# EAGLE design domoLogger (EAGLE 9.6.2)
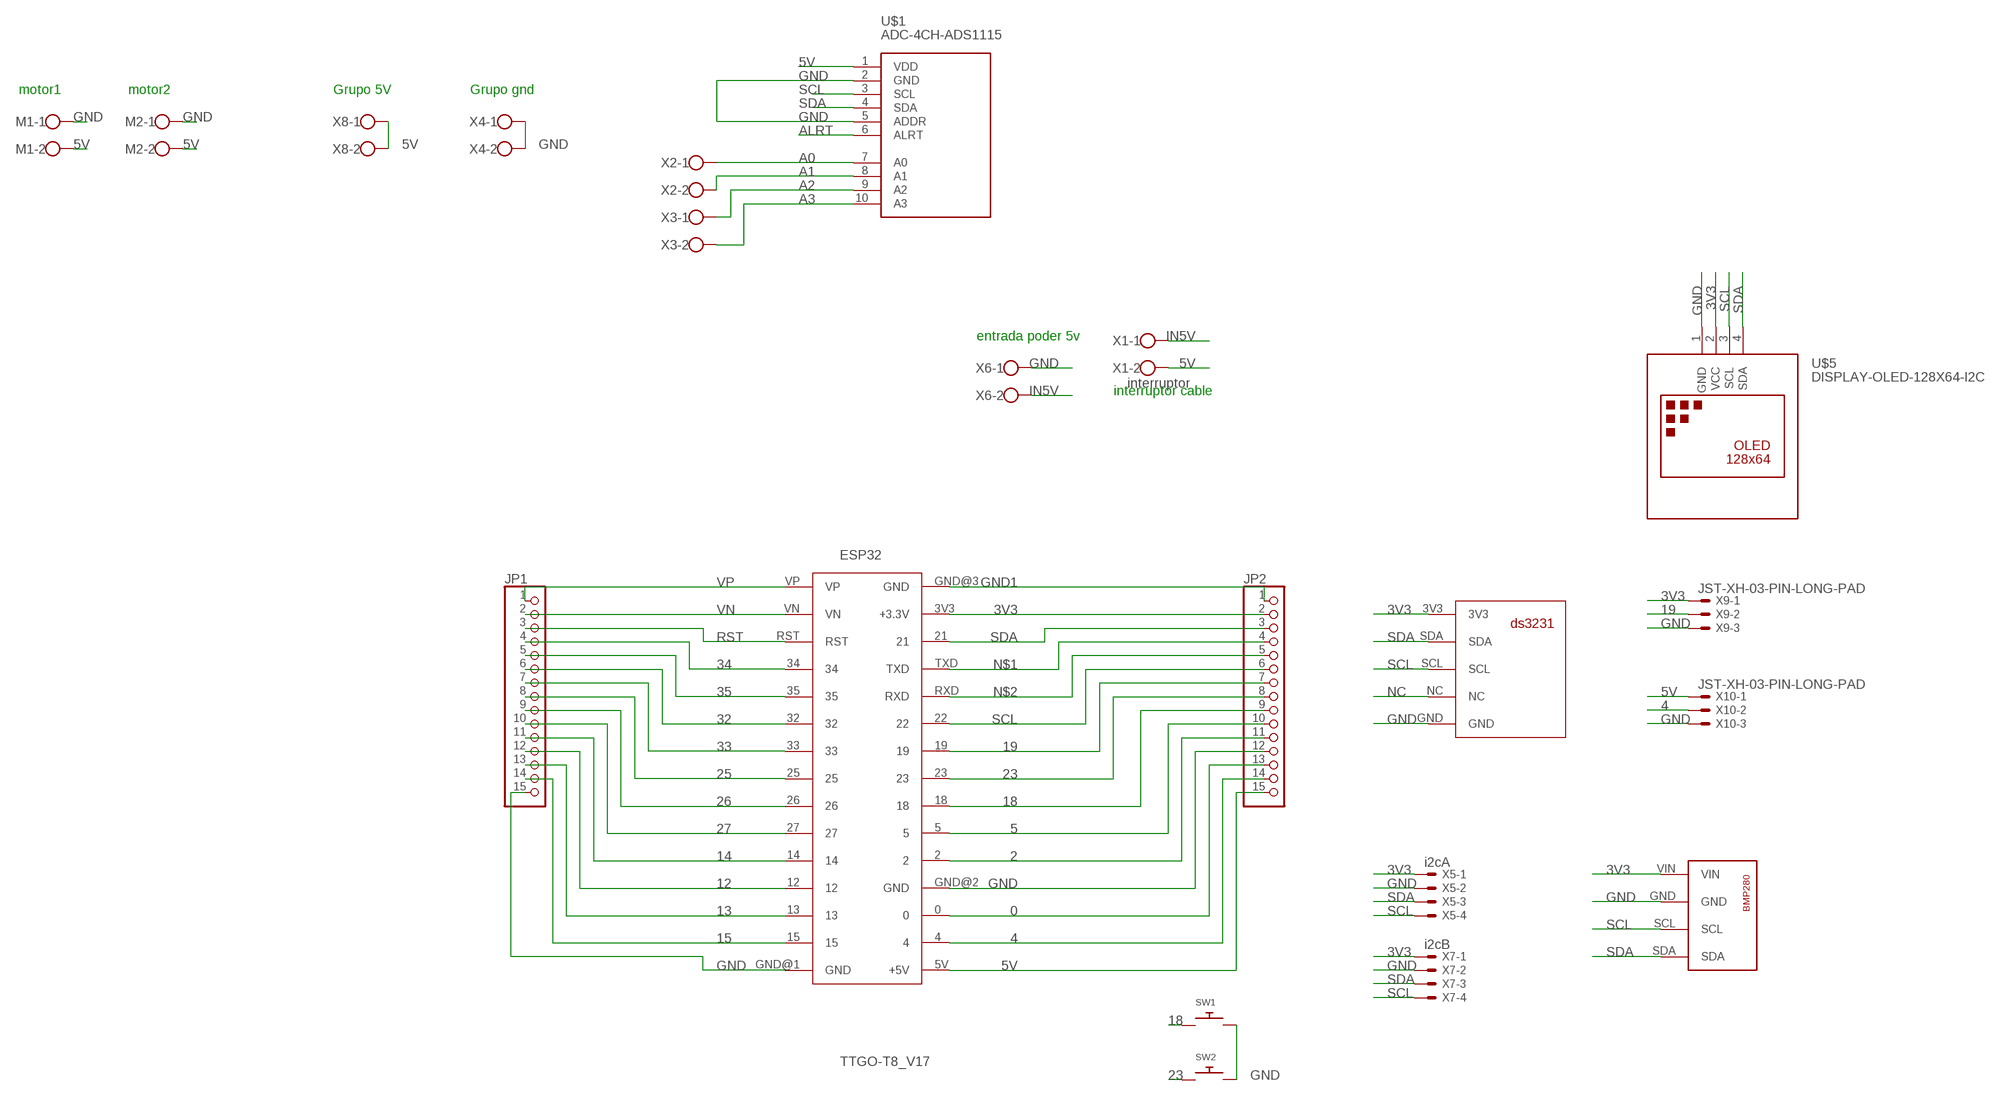
[diagram p0: schematic, sheet 1]

## Parts
ESP32  TTGO-T8_V17  [TTGO-T8_V17]
JP1  PINHD-1X15  [1X15]
JP2  PINHD-1X15  [1X15]
M1  W237-102  [W237-102]
M2  W237-102  [W237-102]
SW1  SWITCH_PUSHBUTTONEVQ-PE  [TACT_PANA-EVQ]
SW2  SWITCH_PUSHBUTTONEVQ-PE  [TACT_PANA-EVQ]
U$1  ADC-4CH-ADS1115  [ADC-4CH-ADS1115]
U$3  GYBMEP_BMP280THROUGH_THE_HOLE  [GYBMEP_BMP280]
U$4  RTC  [RTCDS3231FP]
U$5  DISPLAY-OLED-128X64-I2C  [DISPLAY-OLED-128X64-I2C]
X1  interruptor  W237-102  [W237-102]
X2  W237-102  [W237-102]
X3  W237-102  [W237-102]
X4  W237-102  [W237-102]
X5  i2cA  JST-XH-04-PIN-LONG-PAD  [JST-XH-04-PACKAGE-LONG-PAD]
X6  W237-102  [W237-102]
X7  i2cB  JST-XH-04-PIN-LONG-PAD  [JST-XH-04-PACKAGE-LONG-PAD]
X8  W237-102  [W237-102]
X9  JST-XH-03-PIN-LONG-PAD  [JST-XH-03-PACKAGE-LONG-PAD]
X10  JST-XH-03-PIN-LONG-PAD  [JST-XH-03-PACKAGE-LONG-PAD]

## Nets
0: ESP32.0 JP2.13
2: ESP32.2 JP2.11
3V3: ESP32.3V3(+3.3V) JP2.2 U$3.VIN U$4.3V3 U$5.2(VCC) X5.1 X7.1 X9.1
4: ESP32.4 JP2.14 X10.2
5: ESP32.5 JP2.10
5V: ESP32.5V(+5V) JP2.15 M1.2 M2.2 U$1.1(VDD) X1.2 X8.1 X8.2 X10.1
12: ESP32.12 JP1.12
13: ESP32.13 JP1.13
14: ESP32.14 JP1.11
15: ESP32.15 JP1.14
18: ESP32.18 JP2.9 SW1.P$1
19: ESP32.19 JP2.7 X9.2
23: ESP32.23 JP2.8 SW2.P$1
25: ESP32.25 JP1.8
26: ESP32.26 JP1.9
27: ESP32.27 JP1.10
32: ESP32.32 JP1.6
33: ESP32.33 JP1.7
34: ESP32.34 JP1.4
35: ESP32.35 JP1.5
A0: U$1.7(A0) X2.1
A1: U$1.8(A1) X2.2
A2: U$1.9(A2) X3.1
A3: U$1.10(A3) X3.2
ALRT: U$1.6(ALRT)
GND: ESP32.GND@1(GND) ESP32.GND@2(GND) JP1.15 JP2.12 M1.1 M2.1 SW1.P$2 SW2.P$2 U$1.2(GND) U$1.5(ADDR) U$3.GND U$4.GND U$5.1(GND) X4.1 X4.2 X5.2 X6.1 X7.2 X9.3 X10.3
GND1: ESP32.GND@3(GND) JP2.1
IN5V: X1.1 X6.2
N$1: ESP32.TXD JP2.4
N$2: ESP32.RXD JP2.5
NC: U$4.NC
RST: ESP32.RST JP1.3
SCL: ESP32.22 JP2.6 U$1.3(SCL) U$3.SCL U$4.SCL U$5.3(SCL) X5.4 X7.4
SDA: ESP32.21 JP2.3 U$1.4(SDA) U$3.SDA U$4.SDA U$5.4(SDA) X5.3 X7.3
VN: ESP32.VN JP1.2
VP: ESP32.VP JP1.1

## Notes on the sheet
- motor1 | motor2 | Grupo 5V | Grupo gnd
- entrada poder 5v
- interruptor cable

## Library data of the parts
ESP32 = TTGO-T8:TTGO-T8_V17
JP1 JP2 = adafruit:PINHD-1X15: PIN HEADER
M1 M2 X1-X4 X6 X8 = con-wago-500:W237-102: WAGO SCREW CLAMP; MPN: 237-102; OC_FARNELL: unknown; OC_NEWARK: 70K9898
SW1 SW2 = adafruit:SWITCH_PUSHBUTTON: Buttons SOFTTOUCHSMD_SJ - Soft touch temporary push button (Super Junk Akihabara) Compatible with SKPMANE010 [Mouser: 688-SKPMAN] C&K_KSS = Digikey: KSS221GLFS
U$1 = diy-modules:ADC-4CH-ADS1115: 4 Channel 16-Bit Analog-to-Digital Converter based on ADS1115 chip Arduino ADS1115 Getting Started Tutorial is available here: http://henrysbench.capnfatz.com/henrys-bench/arduino-voltage-measurements/arduino-ads1115-module-getting-started-tutorial/ ADS1115 datasheet is available here: http://www.ti.com/lit/ds/symlink/ads1115.pdf Click here to find device on ebay.com <http://www.ebay.com/sch/ads1115+module>
U$3 = BMP280:GYBMEP_BMP280
U$4 = rtc for pi ds3231:RTC
U$5 = diy-modules:DISPLAY-OLED-128X64-I2C: 128x64 Dot Matrix OLED Module based on SSD1306 chip Variant with I2C interface More details available here: http://www.instructables.com/id/Monochrome-096-i2c-OLED-display-with-arduino-SSD13/ SSD1306 datasheet: https://cdn-shop.adafruit.com/datasheets/SSD1306.pdf Click here to find device on ebay.com <http://www.ebay.com/sch/oled+display+128x64+iic> Note: There are two variants: I2C and SPI. Search for the proper version.
X5 X7 = Rembrandt Electronics - JST XH Connectors v1-0:JST-XH-04-PIN: JST XH Connector 2 Pin Wire to board connector. Pitch: 2,54 mm, (0.100") Number of pins: 4 Created by Rembrandt Electronics www.rembrandtelectronics.com
X9 X10 = Rembrandt Electronics - JST XH Connectors v1-0:JST-XH-03-PIN: JST XH Connector 2 Pin Wire to board connector. Pitch: 2,54 mm, (0.100") Number of pins: 3 Created by Rembrandt Electronics www.rembrandtelectronics.com

## Board
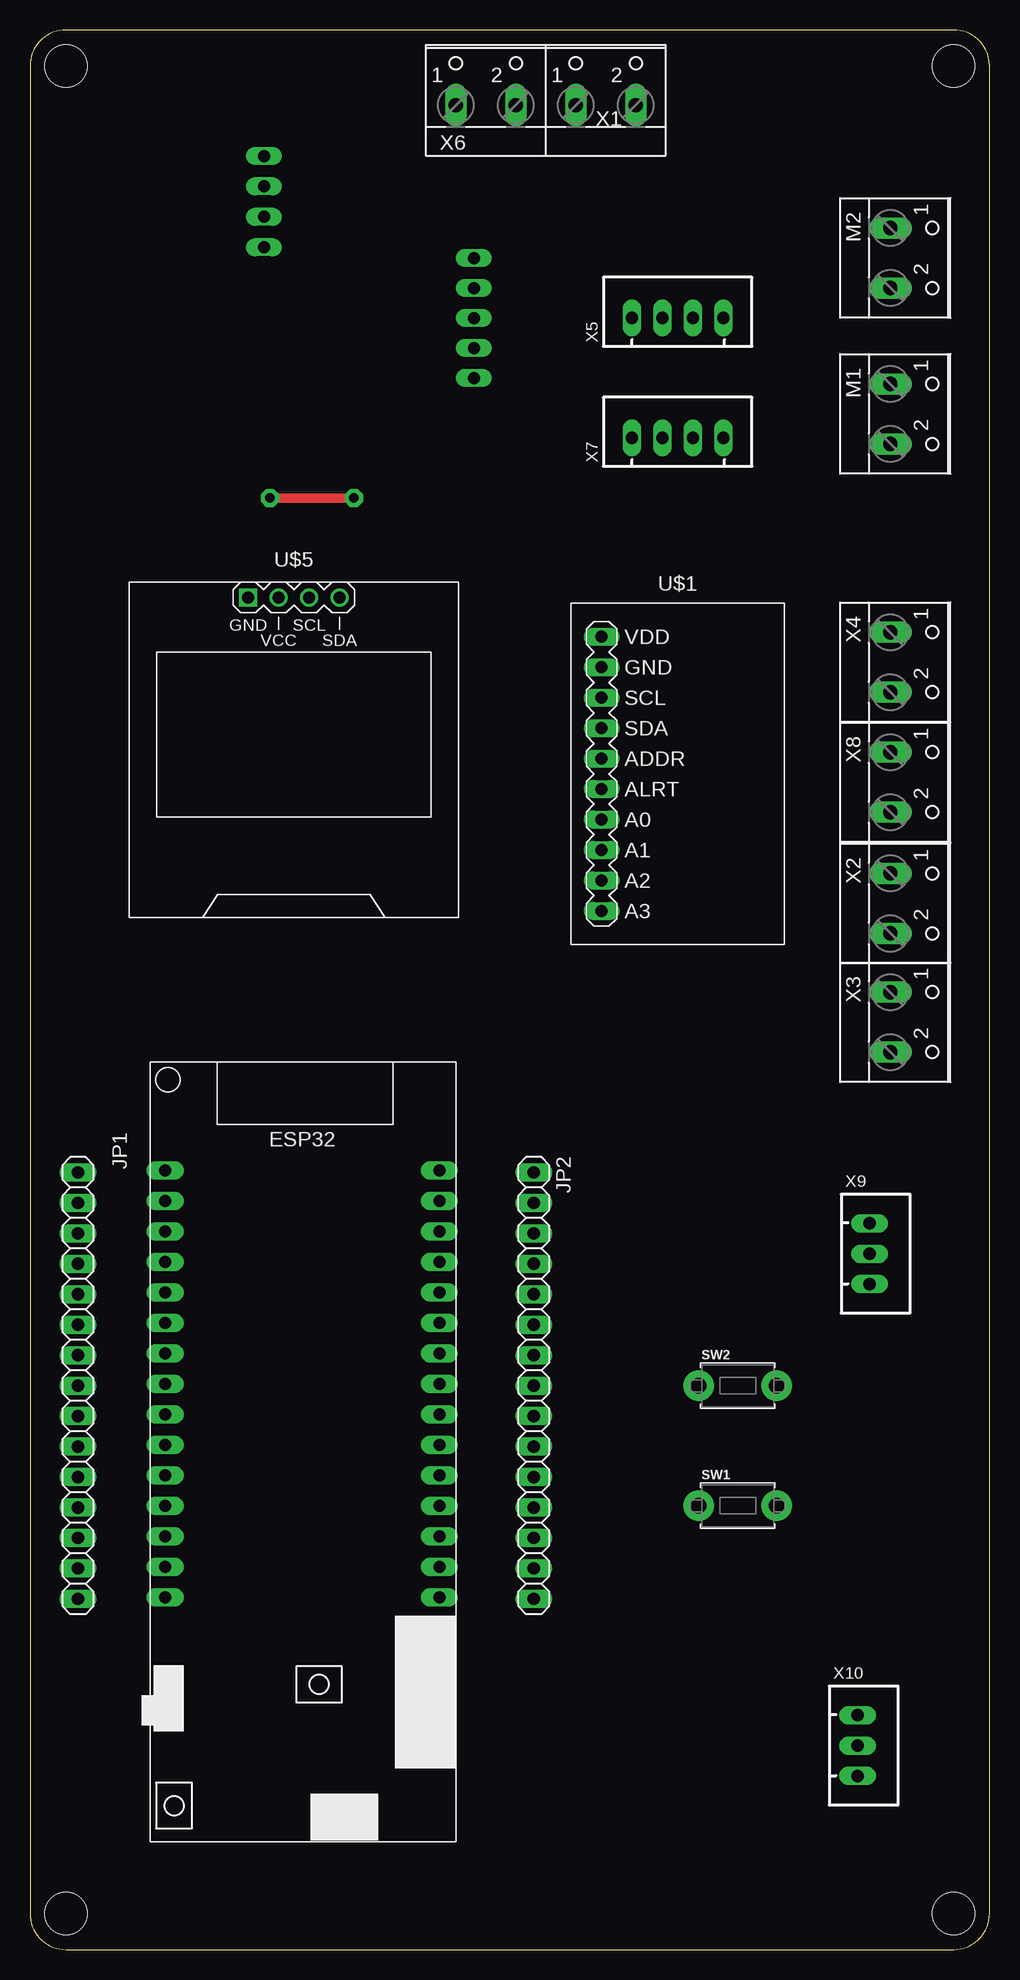
[diagram p1: board, top side]
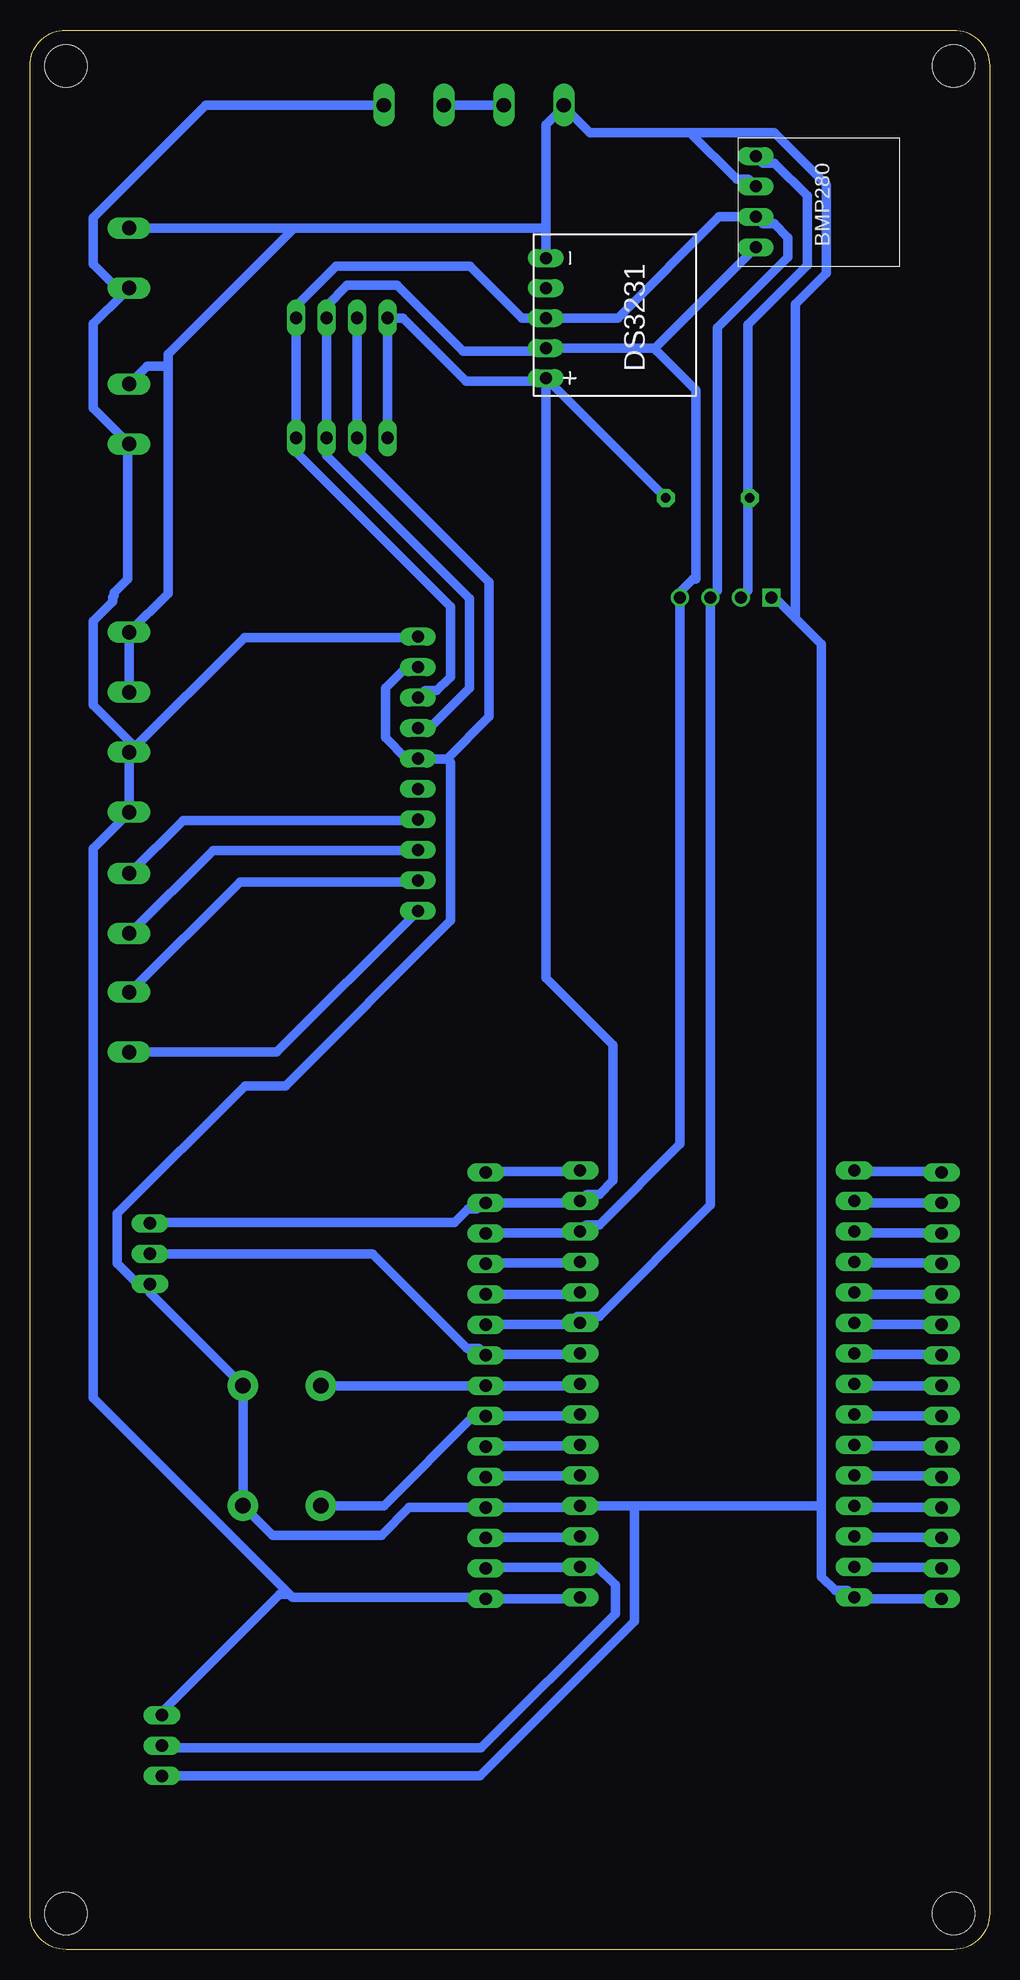
[diagram p2: board, bottom side, seen from below]

Size 80 x 160 mm. Coordinates in mm from the lower left corner, seen from the top.
Outline: 3,0 77,0 arc90 80,3 80,157 arc90 77,160 3,160 arc90 0,157 0,3 arc90 3,0
Copper layers (1*16): Top 0.035mm / dielectric 1.5mm / Bottom 0.035mm
Design rules "default *": minimum track width 0.8mm, minimum drill 0.8mm, track to track 0.8mm, track to pad 0.8mm, pad to pad 0.8mm, via to via 0.8mm, smd to smd 6mil, copper to edge 0.8mm, drill to drill 0.8mm, minimum pad ring 10mil, minimum via ring 8mil, stop-mask expansion 4mil, vias tented up to drill 0mil, thermal gap 10mil
Holes 3.5 mm at 3,3 77,3 3,157 77,157

### Footprints (pad centres in the part's own frame; a part is rotated, then mirrored left to right if it is on the bottom)
TTGO-T8_V17 = drill 1 pad 1.55 long: 0 24.13,-35.56; 2 24.13,-30.48; 3V3 24.13,-7.62; 4 24.13,-38.1; 5 24.13,-27.94; 5V 24.13,-40.64; 12 1.27,-33.02; 13 1.27,-35.56; 14 1.27,-30.48; 15 1.27,-38.1; 18 24.13,-25.4; 19 24.13,-20.32; 21 24.13,-10.16; 22 24.13,-17.78; 23 24.13,-22.86; 25 1.27,-22.86; 26 1.27,-25.4; 27 1.27,-27.94; 32 1.27,-17.78; 33 1.27,-20.32; 34 1.27,-12.7; 35 1.27,-15.24; GND@1 1.27,-40.64; GND@2 24.13,-33.02; GND@3 24.13,-5.08; RST 1.27,-10.16; RXD 24.13,-15.24; TXD 24.13,-12.7; VN 1.27,-7.62; VP 1.27,-5.08
1X15 = drill 1.016 long: 1 -17.78,0; 2 -15.24,0; 3 -12.7,0; 4 -10.16,0; 5 -7.62,0; 6 -5.08,0; 7 -2.54,0; 8 0,0; 9 2.54,0; 10 5.08,0; 11 7.62,0; 12 10.16,0; 13 12.7,0; 14 15.24,0; 15 17.78,0
W237-102 = drill 1.194 long: 1 -2.5,-1.27; 2 2.5,-1.27
TACT_PANA-EVQ = drill 1.3 pad 2.54: P$1 -3.25,0; P$2 3.25,0
ADC-4CH-ADS1115 = drill 1 long: 1 -6.35,11.43; 2 -6.35,8.89; 3 -6.35,6.35; 4 -6.35,3.81; 5 -6.35,1.27; 6 -6.35,-1.27; 7 -6.35,-3.81; 8 -6.35,-6.35; 9 -6.35,-8.89; 10 -6.35,-11.43
GYBMEP_BMP280 = drill 1 long: GND 4.04,1.5; SCL 6.58,1.5; SDA 9.12,1.5; VIN 1.5,1.5
RTCDS3231FP = drill 1 long: 3V3 1,12; GND 1,2; NC 1,4.5; SCL 1,7; SDA 1,9.5
DISPLAY-OLED-128X64-I2C = drill 1 square: 1 -3.81,12.7 | drill 1: 2 -1.27,12.7; 3 1.27,12.7; 4 3.81,12.7
JST-XH-04-PACKAGE-LONG-PAD = drill 1.016 long: 1 -3.81,0; 2 -1.27,0; 3 1.27,0; 4 3.81,0
JST-XH-03-PACKAGE-LONG-PAD = drill 1.016 long: 1 -2.54,0; 2 0,0; 3 2.54,0

### Placement (x,y rotation side)
ESP32  10,70 0 top
JP1  4,47 270 top
JP2  42,47 270 top
M1  73,128 270 top
M2  73,141 270 top
SW1  59,37 0 top
SW2  59,47 0 top
U$1  54,98 0 top
U$3  21,151 270 bottom
U$4  38,143 180 top
U$5  22,100 0 top
X1  48,155 0 top
X2  73,87.2 270 top
X3  73,77.3 270 top
X4  73,107.3 270 top
X5  54,136 0 top
X6  38,155 0 top
X7  54,126 0 top
X8  73,97.3 270 top
X9  70,58 270 top
X10  69,17 270 top

### Tracks (layer width: path | path; a pad name or v marks a point on that pad's centre or on a via)
0
  Bottom 0.8: JP2.13 42,34.38 34.25,34.38 ESP32.0
2
  Bottom 0.8: JP2.11 42,39.5 34.25,39.5 ESP32.2
3V3  (via drill 0.8 pad 1.5)
  Top 0.8: v27,121 v20,121
  Bottom 0.8: X9.1 70,60.62 44.62,60.62 43.5,61.75 42.75,61.75 42.38,62.12 JP2.2 34.38,62.25 34.25,62.38 ESP32.3V3 33.56,62.95 32.54,62.95 31.38,64.1 31.38,75.38 37,81 U$4.3V3 | U$3.VIN 18.91,148.91 17.94,148.91 15.19,146.17 15.19,140.41 20.14,135.46 20.14,121.14 | U$4.3V3 37.25,130.75 43.66,130.75 48.92,136 X5.1 X7.1 | U$4.3V3 v27,121 | 20.14,121.14 v20,121 | U$5.2 20.14,113.29 20.14,121.14
4
  Bottom 0.8: JP2.14 42,31.88 34.25,31.88 ESP32.4 33.6,32 32.8,32 31.2,30.4 31.2,28 42.4,16.8 68.8,16.8 X10.2
5
  Bottom 0.8: JP2.10 42,42 34.25,42 ESP32.5
5V
  Bottom 0.8: 72.25,138 71.75,138.5 M2.2 | 72.25,138 74.72,135.53 74.72,128.49 M1.2 71.88,125.12 71.88,114.25 73,113.12 73,112.88 73.12,112.75 73.12,112.38 74.75,110.75 74.75,103.75 71.5,100.5 X8.1 | ESP32.5V 34.25,29.25 42,29.25 JP2.15 42.16,29.38 58.12,29.38 | X8.1 71.75,99.5 71.75,94.88 X8.2 71.73,94.77 74.72,91.78 74.72,45.98 58.12,29.38 | X8.1 71.7,99.8 62.12,109.38 47.7,109.38 U$1.1 | 72.25,138 74.72,140.47 74.72,144.37 65.36,153.73 X1.2 | X10.1 68.8,20 59.2,29.6 58.4,29.6 58.12,29.38
12
  Bottom 0.8: JP1.12 4,36.88 11.25,36.88 ESP32.12
13
  Bottom 0.8: JP1.13 4,34.38 11.25,34.38 ESP32.13
14
  Bottom 0.8: JP1.11 4,39.5 11.25,39.5 ESP32.14
15
  Bottom 0.8: JP1.14 4,31.88 11.25,31.88 ESP32.15
18
  Bottom 0.8: ESP32.18 34.25,44.5 42,44.5 JP2.9 43.04,44.46 50.5,37 SW1.P$1
19
  Bottom 0.8: ESP32.19 34.25,49.62 42,49.62 JP2.7 42.58,50.12 43.58,50.12 51.46,58 X9.2
23
  Bottom 0.8: ESP32.23 34.25,47.12 34.38,47 JP2.8 SW2.P$1
25
  Bottom 0.8: JP1.8 11.12,47 11.25,47.12 ESP32.25
26
  Bottom 0.8: JP1.9 4,44.5 11.25,44.5 ESP32.26
27
  Bottom 0.8: JP1.10 4,42 11.25,42 ESP32.27
32
  Bottom 0.8: JP1.6 4,52.12 11.25,52.12 ESP32.32
33
  Bottom 0.8: JP1.7 4,49.62 11.25,49.62 ESP32.33
34
  Bottom 0.8: JP1.4 4,57.25 11.25,57.25 ESP32.34
35
  Bottom 0.8: JP1.5 11.12,54.62 11.25,54.75 ESP32.35
A0
  Bottom 0.8: X2.1 71.67,89.7 67.25,94.12 47.72,94.12 U$1.7
A1
  Bottom 0.8: X2.2 71.67,84.7 64.75,91.62 47.67,91.62 U$1.8
A2
  Bottom 0.8: X3.1 71.7,79.8 62.5,89 47.76,89 U$1.9
A3
  Bottom 0.8: X3.2 59.42,74.8 U$1.10
GND
  Bottom 0.8: JP1.15 4,29.25 11.25,29.25 ESP32.GND@1 11.84,29.93 12.86,29.93 14.02,31.08 14.02,37 | 37,143.5 37,152.12 35.5,153.62 | 37,143.5 U$4.GND | 35.5,153.62 X6.1 | X4.2 71.75,104.88 71.75,109.75 X4.1 68.5,113.03 68.5,132 | U$5.1 18.19,113 16.19,111 | 16.19,111 16.19,137.15 13.59,139.75 13.59,147.11 17.94,151.45 24.97,151.45 | 35.5,153.62 33.33,151.45 24.97,151.45 | 16.19,111 14.02,108.83 14.02,37 | U$3.GND 20.09,147.55 21.06,147.55 24.97,151.45 | X5.2 52.75,136 52.75,126 X7.2 52.73,124.98 41.74,113.99 41.74,102.76 45.25,99.25 | 45.25,99.25 47.25,99.25 U$1.5 48.63,99.27 50.36,101 50.36,105.16 48.64,106.88 47.66,106.88 U$1.2 | 37,143.5 58,143.5 | 58,143.5 M2.1 | 14.02,37 29.6,37 | 29.6,37 33.75,37 ESP32.GND@2 34.25,36.88 42,36.88 JP2.12 48.4,36.84 50.71,34.53 59.78,34.53 SW1.P$2 SW2.P$2 70,54.75 X9.3 70.04,55.5 71.04,55.5 72.72,57.19 72.72,61.35 62.08,72 58.7,72 44.94,85.76 44.94,98.94 45.25,99.25 | 58,143.5 68.5,133 68.5,132 | 68.5,132 70.23,132 M1.1 | 29.6,37 29.6,27.34 42.48,14.46 X10.3
GND1
  Bottom 0.8: JP2.1 42,64.88 34.25,64.88 ESP32.GND@3
IN5V
  Bottom 0.8: X6.2 X1.1
N$1
  Bottom 0.8: JP2.4 42,57.25 34.25,57.25 ESP32.TXD
N$2
  Bottom 0.8: JP2.5 34.38,54.62 34.25,54.75 ESP32.RXD
RST
  Bottom 0.8: JP1.3 4,59.75 11.25,59.75 ESP32.RST
SCL
  Bottom 0.8: 35,52.12 34.25,52.12 ESP32.22 | 35,52.12 42,52.12 JP2.6 | 35,52.12 34.34,52.78 32.54,52.78 23.27,62.05 U$5.3 22.68,113.29 22.68,135.18 16.79,141.07 16.79,142.69 17.94,143.83 18.91,143.83 U$3.SCL 22.58,144.42 31,136 U$4.SCL 39,136 43.32,140.32 54.48,140.32 58,136.81 57.81,136.62 X5.4 X7.4 57.81,124.8 44.94,111.93 44.94,106.08 46.09,104.94 47.06,104.94 U$1.3
SDA
  Bottom 0.8: 34.25,59.75 42,59.75 JP2.3 | 34.25,59.75 ESP32.21 | 34.25,59.75 33.59,60.41 32.54,60.41 25.81,67.13 U$5.4 26,113 24.75,114.25 24.5,114.25 24.5,130 27.75,133.25 27.88,133.5 | 27.88,133.5 U$4.SDA 37.25,133.25 43.9,133.25 49.38,138.72 53.54,138.72 55.27,137 X5.3 X7.3 55.27,124.52 43.34,112.59 43.34,105.14 46.67,101.81 U$1.4 | 27.88,133.5 U$3.SDA
VN
  Bottom 0.8: JP1.2 11.12,62.25 11.25,62.38 ESP32.VN
VP
  Bottom 0.8: JP1.1 4,64.88 11.25,64.88 ESP32.VP